# Altium schematic sheet ADC.SchDoc
size A; SheetNumber: 4; SheetTotal: 8
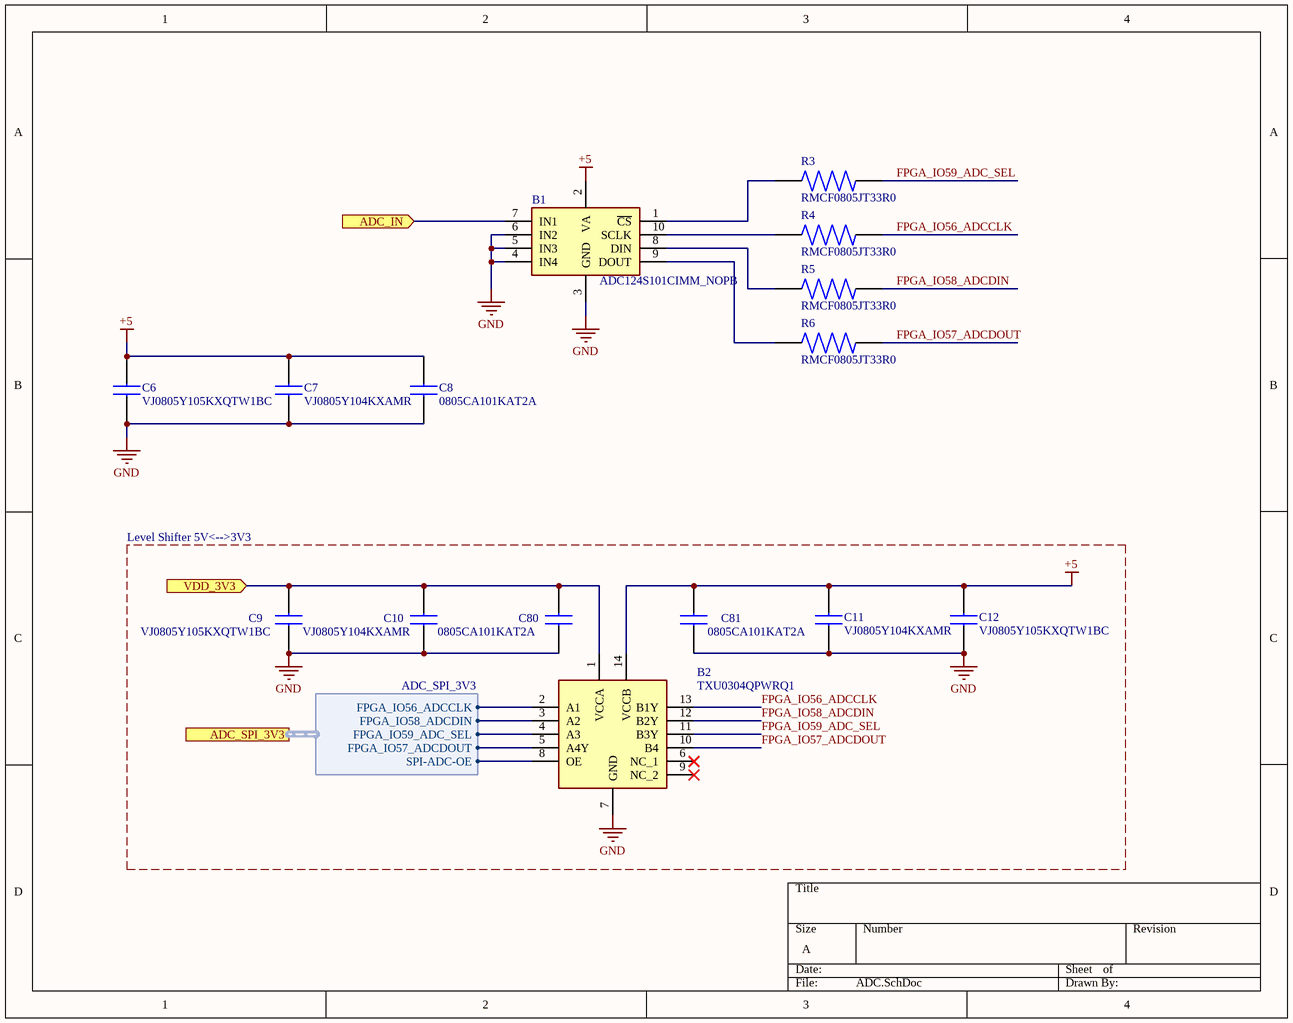
[diagram p0: ADC.SchDoc]

## Parts
B1  ADC124S101CIMM_NOPB  [SOP50P490X110-10N]
B2  TXU0304QPWRQ1  [SOP65P640X120-14N]
C6  VJ0805Y105KXQTW1BC  [CAPC2012X135N]
C7  VJ0805Y104KXAMR  [CAPC2012X145N]
C8  0805CA101KAT2A  [CAPC2112X94N]
C9  VJ0805Y105KXQTW1BC  [CAPC2012X135N]
C10  VJ0805Y104KXAMR  [CAPC2012X145N]
C11  VJ0805Y104KXAMR  [CAPC2012X145N]
C12  VJ0805Y105KXQTW1BC  [CAPC2012X135N]
C80  0805CA101KAT2A  [CAPC2112X94N]
C81  0805CA101KAT2A  [CAPC2112X94N]
R3  RMCF0805JT33R0  [STA_RMCF0805_STP]
R4  RMCF0805JT33R0  [STA_RMCF0805_STP]
R5  RMCF0805JT33R0  [STA_RMCF0805_STP]
R6  RMCF0805JT33R0  [STA_RMCF0805_STP]

## Blocks framed on the sheet
Level Shifter 5V<-->3V3: B2 C9-C12 C80 C81

## Ports
ADC_IN (in), ADC_SPI_3V3 (harness ADC_SPI_3V3), VDD_3V3 (in)

## Harnesses
ADC_SPI_3V3: FPGA_IO56_ADCCLK, FPGA_IO58_ADCDIN, FPGA_IO57_ADCDOUT, FPGA_IO59_ADC_SEL, SPI-ADC-OE

## Nets
+5: B1.2(VA) B2.14(VCCB) C6.2 C7.2 C8.2 C11.2 C12.2 C81.2
GND: B1.3(GND) B1.4(IN4) B1.5(IN3) B1.6(IN2) B2.7(GND) C6.1 C7.1 C8.1 C9.1 C10.1 C11.1 C12.1 C80.1 C81.1
ADC_IN: B1.7(IN1) ; port ADC_IN
FPGA_IO56_ADCCLK: B2.13(B1Y) R4.2
FPGA_IO57_ADCDOUT: B2.10(B4) R6.2
FPGA_IO58_ADCDIN: B2.12(B2Y) R5.2
FPGA_IO59_ADC_SEL: B2.11(B3Y) R3.2
VDD_3V3: B2.1(VCCA) C9.2 C10.2 C80.2 ; port VDD_3V3
NetB1_1: B1.1(~{CS}) R3.1
NetB1_8: B1.8(DIN) R5.1
NetB1_9: B1.9(DOUT) R6.1
NetB1_10: B1.10(SCLK) R4.1
NetB2_2: B2.2(A1) ; port ADC_SPI_3V3.FPGA_IO56_ADCCLK
NetB2_3: B2.3(A2) ; port ADC_SPI_3V3.FPGA_IO58_ADCDIN
NetB2_4: B2.4(A3) ; port ADC_SPI_3V3.FPGA_IO59_ADC_SEL
NetB2_5: B2.5(A4Y) ; port ADC_SPI_3V3.FPGA_IO57_ADCDOUT
NetB2_8: B2.8(OE) ; port ADC_SPI_3V3.SPI-ADC-OE

Not connected (* = marked no-connect by the designer): B2 6(NC_1)* 9(NC_2)*

## Library data of the parts
B1 = ADC124S101CIMM_NOPB: 4 Channel, 500 ksps to 1 Msps, 12-Bit A/D Converter; Manufacturer_Name: Texas Instruments; Manufacturer_Part_Number: ADC124S101CIMM/NOPB; Geometry.Height: 1.1mm; Mouser Part Number: 926-AD124S101CIMMNPB; Mouser Price/Stock: https://www.mouser.co.uk/ProductDetail/Texas-Instruments/ADC124S101CIMM-NOPB?qs=7X5t%252BdzoRHD7V7sCz8DzxQ%3D%3D; Datasheet Link: http://www.ti.com/lit/ds/symlink/adc124s101.pdf
B2 = TXU0304QPWRQ1: Voltage Level Translator Unidirectional 1 Circuit 4 Channel 200Mbps TSSOP-14; Manufacturer_Name: Texas Instruments; Geometry.Height: 1.2mm; Mouser Part Number: 595-TXU0304QPWRQ1; Mouser Price/Stock: https://www.mouser.co.uk/ProductDetail/Texas-Instruments/TXU0304QPWRQ1?qs=QNEnbhJQKvZXfjMNvwmKIA%3D%3D; Manufacturer_Part_Number: TXU0304QPWRQ1; Datasheet Link: https://www.ti.com/lit/ds/symlink/txu0304-q1.pdf
C6 C9 C12 = VJ0805Y105KXQTW1BC: 1 µF ±10% 10V Ceramic Capacitor X7R 0805 (2012 Metric); Manufacturer_Name: Vishay; Geometry.Height: 1.35mm; Mouser Part Number: 77-VJ0805Y105KXQTBC; Mouser Price/Stock: https://www.mouser.co.uk/ProductDetail/Vishay-Vitramon/VJ0805Y105KXQTW1BC?qs=F2lBERbFaaHnNHh23%2Flzkg%3D%3D; Manufacturer_Part_Number: VJ0805Y105KXQTW1BC; Datasheet Link: https://www.vishay.com/docs/28548/vjw1bcbascomseries.pdf
C7 C10 C11 = VJ0805Y104KXAMR: Multilayer Ceramic Capacitors MLCC - SMD/SMT 0805 0.1uF 50volts X7R 10%; Manufacturer_Name: Vishay; Geometry.Height: 1.45mm; Mouser Part Number: 77-VJ0805Y104KXAMR; Mouser Price/Stock: https://www.mouser.co.uk/ProductDetail/Vishay-Vitramon/VJ0805Y104KXAMR?qs=iPOr8XgPdiSpDWrmTedxnA%3D%3D; Manufacturer_Part_Number: VJ0805Y104KXAMR; Datasheet Link: http://www.vishay.com/docs/45226/vj31xrohsautomlcc.pdf
C8 C80 C81 = 0805CA101KAT2A: 100 pF +/-10% 1000V (1kV) Ceramic Capacitor C0G, NP0 0805 (2012 Metric); Manufacturer_Name: Kyocera AVX; Geometry.Height: 0.94mm; Mouser Part Number: 581-0805CA101KAT2A; Mouser Price/Stock: https://www.mouser.co.uk/ProductDetail/KYOCERA-AVX/0805CA101KAT2A?qs=ZBeOGGPQgEHtR%2FQeWT8jmQ%3D%3D; Manufacturer_Part_Number: 0805CA101KAT2A; Datasheet Link: https://datasheets.kyocera-avx.com/AVX-HV_MLCC.pdf
R3-R6 = RMCF0805JT33R0: RES 33 OHM 5% 1/8W 0805; Manufacturer_Name: Stackpole International; Copyright: Copyright (C) 2026 Ultra Librarian. All rights reserved.; Manufacturer_Part_Number: RMCF0805JT33R0